# Altium schematic sheet HMS_Solar.SchDoc
size A
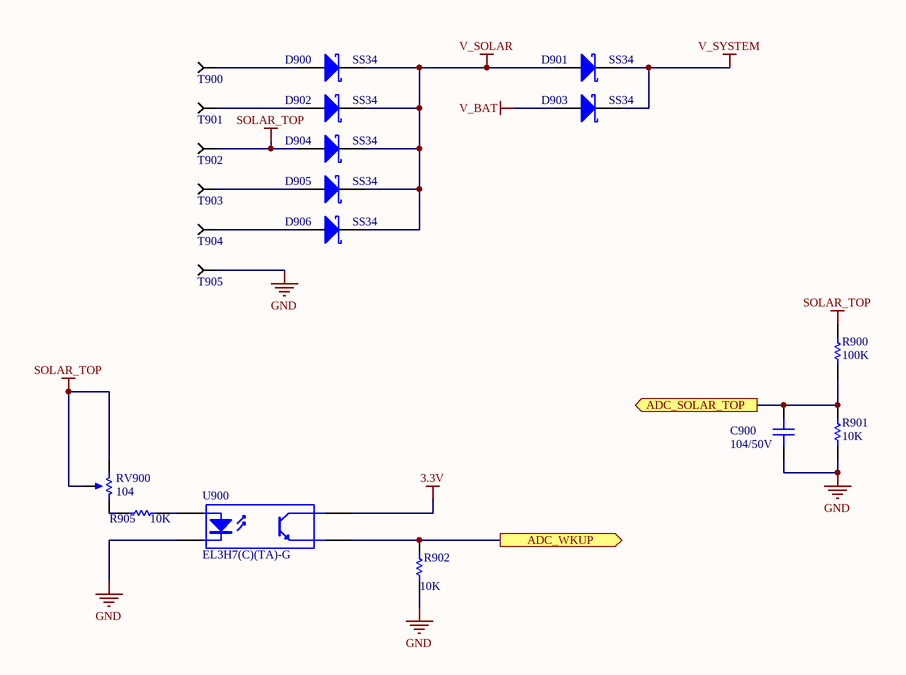
[diagram p0: HMS_Solar.SchDoc]

## Parts
C900  104/50V  [CAP_CERAMIC_0402(1005)]
D900  SS34  [DO214AC_SMA_1808]
D901  SS34  [DO214AC_SMA_1808]
D902  SS34  [DO214AC_SMA_1808]
D903  SS34  [DO214AC_SMA_1808]
D904  SS34  [DO214AC_SMA_1808]
D905  SS34  [DO214AC_SMA_1808]
D906  SS34  [DO214AC_SMA_1808]
R900  100K  [RES_0402(1005)]
R901  10K  [RES_0402(1005)]
R902  10K  [RES_0402(1005)]
R905  10K  [RES_0402(1005)]
RV900  104  [RES_VAR_Type1]
T900  Test Point  [TP_2]  (value not drawn)
T901  Test Point  [TP_2]  (value not drawn)
T902  Test Point  [TP_2]  (value not drawn)
T903  Test Point  [TP_2]  (value not drawn)
T904  Test Point  [TP_2]  (value not drawn)
T905  Test Point  [TP_2]  (value not drawn)
U900  EL3H7(C)(TA)-G  [Opto small]

## Ports
ADC_SOLAR_TOP (out), ADC_WKUP (out)

## Nets
3.3V: U900.4
GND: C900.1 R901.1 R902.1 T905.1 U900.2
SOLAR_TOP: D904.1(A) R900.2 RV900.2 RV900.3 T902.1
V_BAT: D903.1(A)
V_SOLAR: D900.2(K) D901.1(A) D902.2(K) D904.2(K) D905.2(K) D906.2(K)
V_SYSTEM: D901.2(K) D903.2(K)
ADC_SOLAR_TOP: C900.2 R900.1 R901.2 ; port ADC_SOLAR_TOP
ADC_WKUP: R902.2 U900.3 ; port ADC_WKUP
NetD900_1: D900.1(A) T900.1
NetD902_1: D902.1(A) T901.1
NetD905_1: D905.1(A) T903.1
NetD906_1: D906.1(A) T904.1
NetR905_1: R905.1 U900.1
NetR905_2: R905.2 RV900.1

## Library data of the parts
C900 = Cap Cer 0603 (1608): CAP CER 0.1UF 50V X5R 0402; MPN: CC0402KRX5R9BB104; Published: 8-Jun-2000; LatestRevisionDate: 17-Jul-2002; LatestRevisionNote: Re-released for DXP Platform.; PackageReference: RAD-0.3; Publisher: Altium Limited; Value: 104/50V
D900-D906 = Diode B340A: Diode Schottky 3A/40V DO-214AB; Published: 8-Jun-2000; LatestRevisionDate: 17-Jul-2002; LatestRevisionNote: Re-released for DXP Platform.; PackageReference: SMB; Publisher: Altium Limited; Code_JEDEC: DO-214-AA; Value: SS34; MPN: SS34
R900 = Res1: Resistor 100K 1/8W 1% 0402; MPN: RC0402JR-07100KL; Published: 8-Jun-2000; LatestRevisionDate: 17-Jul-2002; LatestRevisionNote: Re-released for DXP Platform.; PackageReference: AXIAL-0.3; Publisher: Altium Limited; Value: 100K
R901 = Res1: RES 10K OHM 5% 1/8W 0402; MPN: RC0402JR-0710KL; Published: 8-Jun-2000; LatestRevisionDate: 17-Jul-2002; LatestRevisionNote: Re-released for DXP Platform.; PackageReference: AXIAL-0.3; Publisher: Altium Limited; Value: 10K
R902 R905 = Res1: RES 10K OHM 5% 1/8W 0402; MPN: RC0402JR-0710KL; MFR: YAGEO; Published: 8-Jun-2000; LatestRevisionDate: 17-Jul-2002; LatestRevisionNote: Re-released for DXP Platform.; PackageReference: AXIAL-0.3; Publisher: Altium Limited; PackageDescription: Axial Device, Thru-Hole; 2 Leads; 0.3 in Pin Spacing; Value: 10K; Category: Chip Resistor - Surface Mount
RV900 = Res_Vol_Single: Volume Varistor Single 100K; MPN: 3296W-104; Sim Note: Enter the Resistance value and the set point into parameter fields.; Set Position: 0.5; Published: 8-Jun-2000; LatestRevisionDate: 17-Jul-2002; LatestRevisionNote: Re-released for DXP Platform.; PackageReference: VR5; Publisher: Altium Limited; Value: 104
U900 = OPTOISO1: Optoisolator Transistor Output 3750Vrms 1 Channel 4-SOP; MFR: Vishay Semiconductor Opto Division; Component Type: IC; MPN: EL3H7(C)(TA)-G; Value: EL3H7(C)(TA)-G; Category: Optoisolators - Transistor, Photovoltaic Output